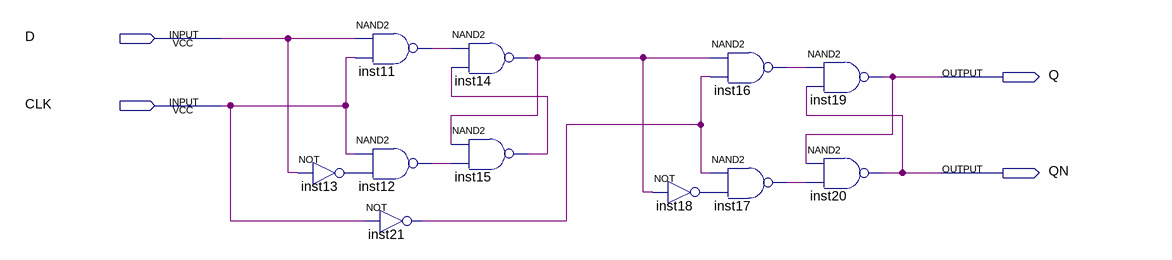
[diagram p0: schematic sheet]
// Quartus schematic lab9step3a.bdf as structural Verilog: 11 symbols, 4 pins
module lab9step3a (
  input  D,
  input  CLK,
  output Q,
  output QN
);

  wire inst11_out, inst12_out, inst13_out, inst14_out, inst15_out, inst16_out, inst17_out, inst18_out,
       inst21_out;

  not inst13 (inst13_out, D);
  nand inst11 (inst11_out, D, CLK);
  nand inst12 (inst12_out, CLK, inst13_out);
  not inst21 (inst21_out, CLK);
  nand inst14 (inst14_out, inst11_out, inst15_out);
  nand inst15 (inst15_out, inst14_out, inst12_out);
  nand inst16 (inst16_out, inst14_out, inst21_out);
  nand inst17 (inst17_out, inst21_out, inst18_out);
  not inst18 (inst18_out, inst14_out);
  nand inst19 (Q, inst16_out, QN);
  nand inst20 (QN, Q, inst17_out);
endmodule
